# Altium project PieZense_Leader.PrjPcb (part 3 of 3)
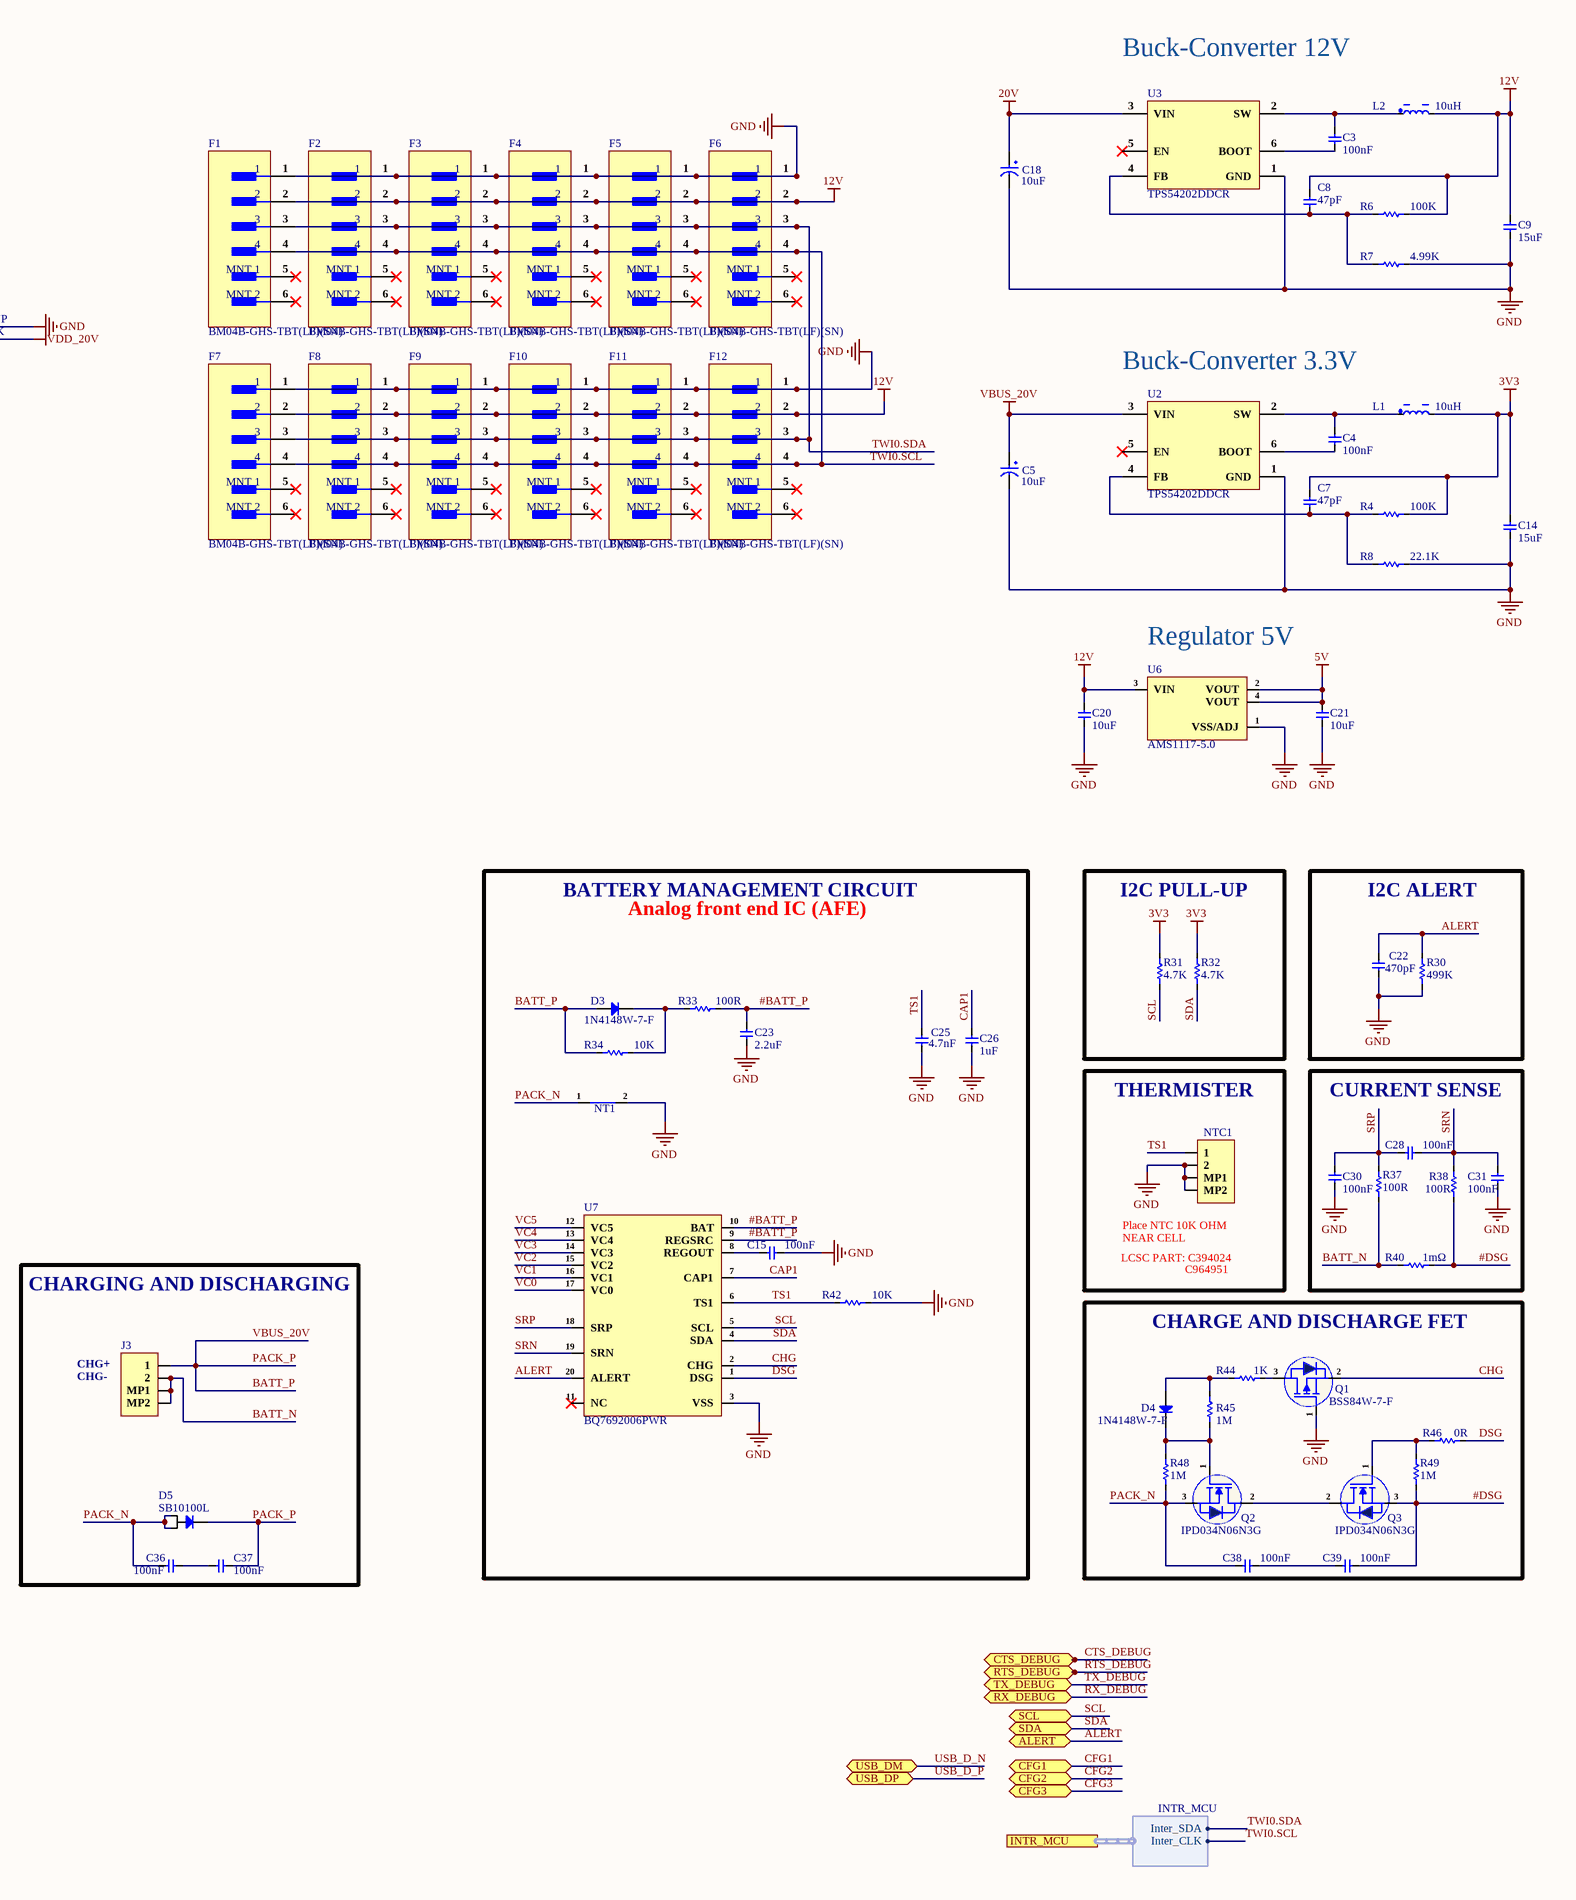
[diagram p4: Piezo_Regulator_Head_Power.SchDoc, right]

## Sheet Piezo_Regulator_Head_Power.SchDoc (continued)

### Library data of the parts (continued)
R44 = RC0805FR-071KL: RES 1K OHM 1% 1/8W 0805; Manufacturer: Yageo; Value: 1kR; Voltage Rating (DC): 150V; Temperature Coefficient: 100ppm/°C; Power Rating: 125mW; Item Type: Resistor; Supplier: Future Electronics; Supplier Part Number: 8126013; Manufacturer Part Number: RC0805FR-071KL; RoHS: Yes; Category: Chip SMD Resistors; Stock: 8305000; Pricing: 5000=0.117, 25000=0.112, 125000=0.107, 500000=0.104, 1250000=0.0981 (USD); Case/Package: 0805; Pins: 2; Case Code (Metric): 2012; Case Code (Imperial): 0805; Min Operating Temperature: -55°C; Max Operating Temperature: 155°C; Tolerance: 1%; Packaging: Tape and Reel; Resistor Type: Thick Film; Package Quantity: 1; Voltage Rating: 150V; Termination: SMD/SMT; Series: RC; Number of Terminations: 2; Max Power Dissipation: 125mW; Features: Moisture Resistant; Resistance Tolerance: 1%; Construction: Rectangular; Voltage Rating (AC): 150V; Length: 0.079inch; Width: 0.049inch; Height: 0.024inch; Depth: 1.25mm; Reach SVHC Compliant: No; Lead Free: 5697LeadFree; RoHS Compliant: Yes; Military Standard: Not; ComponentLink1URL: https://datasheet.ciiva.com/7941/1686128-7941719.pdf?src-supplier=Element14; ComponentLink1Description: https://datasheet.ciiva.com/7941/1686128-7941719.pdf?src-supplier=Element14; ComponentLink2URL: https://datasheet.ciiva.com/46385/444164-46385020.pdf?src-supplier=Element14; ComponentLink2Description: https://datasheet.ciiva.com/46385/444164-46385020.pdf?src-supplier=Element14; ComponentLink3URL: https://datasheet.ciiva.com/2456/pyu-r-int-thick-7-2456976.pdf?src-supplier=Digi-Key; ComponentLink3Description: https://datasheet.ciiva.com/2456/pyu-r-int-thick-7-2456976.pdf?src-supplier=Digi-Key; ComponentLink4URL: https://datasheet.ciiva.com/2456/pyu-r-int-thick-7-2456977.pdf?src-supplier=Digi-Key; ComponentLink4Description: https://datasheet.ciiva.com/2456/pyu-r-int-thick-7-2456977.pdf?src-supplier=Digi-Key; ComponentLink5URL: https://datasheet.ciiva.com/2456/pyu-r-int-thick-7-2456975.pdf?src-supplier=Digi-Key; ComponentLink5Description: https://datasheet.ciiva.com/2456/pyu-r-int-thick-7-2456975.pdf?src-supplier=Digi-Key; ComponentLink6URL: https://datasheet.ciiva.com/16850/rc0805-16850409.pdf?src-supplier=Future+Electronics; ComponentLink6Description: https://datasheet.ciiva.com/16850/rc0805-16850409.pdf?src-supplier=Future+Electronics; LCSC Part Number: C95781
R45 R48 R49 = RC0805FR-071ML: RES 1M OHM 1% 1/8W 0805; Manufacturer: Yageo; Value: 1MR; Power Rating: 125mW; Temperature Coefficient: 250ppm/°C; Voltage Rating: 150V; Item Type: Resistor; Supplier: Future Electronics; Supplier Part Number: 7283393; Manufacturer Part Number: RC0805FR-071ML; RoHS: Yes; Category: Chip SMD Resistors; Stock: 2655000; Pricing: 5000=0.0027, 25000=0.0025, 125000=0.0024, 500000=0.0023, 1250000=0.0021 (USD); Case/Package: Molded; Case Code (Metric): 2012; Case Code (Imperial): 0805; Min Operating Temperature: -55°C; Max Operating Temperature: 155°C; Resistor Type: Thick Film; Tolerance: 1%; Packaging: Tape and Reel; Construction: Rectangular; Resistance Tolerance: 1%; Voltage Rating (AC): 150V; Length: 2mm; Depth: 1.25mm; Lead Free: Lead Free; RoHS Compliant: Yes; Reach SVHC Compliant: Unknown; Military Standard: Not; LCSC Part Number: C107700
R46 = RC0805FR-070RL: RES 0 OHM JUMPER 1/8W 0805; Manufacturer: Yageo; Resistance: 0mR; Tolerance: 1%; Power Rating: 125mW; Item Type: Resistor; Supplier 1: Avnet; Manufacturer Part Number: RC0805FR-070RL; RoHS: Yes; Category: Chip SMD Resistors; Stock 1: 85000; Pricing 1: 5000=0.00281, 10000=0.00277, 20000=0.00269 (USD); Case/Package: 0805; Contact Plating: Tin,Matte; Case Code (Imperial): 0805; Case Code (Metric): 2012; Size Code: 0805; Min Operating Temperature: -55°C; Max Operating Temperature: 155°C; Resistor Type: Thick Film; Packaging: Tape and Reel; Features: Moisture Resistant; Series: RC; Max Power Dissipation: 125mW; Number of Terminations: 2; Construction: Rectangular; Length: 2mm; Depth: 1.25mm; Radiation Hardening: No; Military Standard: Not; Lead Free: Lead Free; RoHS Compliant: Yes; ComponentLink1URL: https://datasheet.ciiva.com/15189/getdatasheetpartid-348154-15189885.pdf?src-supplier=Verical; ComponentLink1Description: https://datasheet.ciiva.com/15189/getdatasheetpartid-348154-15189885.pdf?src-supplier=Verical; ComponentLink2URL: https://datasheet.ciiva.com/17042/rc0805-17042698.pdf?src-supplier=Future+Electronics; ComponentLink2Description: https://datasheet.ciiva.com/17042/rc0805-17042698.pdf?src-supplier=Future+Electronics; Supplier Part Number 1: RC0805FR-070RL; LCSC Part Number: C100045
R54 = CRCW06031K00FKEA: RES SMD 1K OHM 1% 1/10W 0603; Manufacturer: Vishay Dale; Temperature Coefficient: 100ppm/°C; Voltage Rating (DC): 75V; Power Rating: 100mW; Item Type: Resistor; Value: 1kR; Manufacturer Part Number: CRCW06031K00FKEA; RoHS: Yes; Category: Chip SMD Resistors; Case/Package: 0603; Case Code (Imperial): 0603; Case Code (Metric): 1608; Min Operating Temperature: -55°C; Max Operating Temperature: 155°C; Resistor Type: Thick Film; Tolerance: 1%; Packaging: Tape and Reel; Voltage Rating: 75V; Termination: SMD/SMT; Features: Automotive AEC-Q200; Series: CRCW; Max Power Dissipation: 100mW; Number of Terminations: 2; Resistance Tolerance: 1%; Construction: Rectangular; Technology: THICK FILM; Length: 1.55mm; Width: 0.85mm; Height: 0.45mm; Depth: 0.85mm; Reach SVHC Compliant: Unknown; Lead Free: 5697LeadFree; RoHS Compliant: Yes; Military Standard: Not; ComponentLink1URL: https://datasheet.ciiva.com/11808/0900766b80d98afc-11808625.pdf?src-supplier=Rs; ComponentLink1Description: https://datasheet.ciiva.com/11808/0900766b80d98afc-11808625.pdf?src-supplier=Rs; ComponentLink2URL: https://datasheet.ciiva.com/11808/0900766b80d98afc-11808625.pdf?src-supplier=Rs; ComponentLink2Description: https://datasheet.ciiva.com/11808/0900766b80d98afc-11808625.pdf?src-supplier=Rs; ComponentLink3URL: https://datasheet.ciiva.com/46441/1720486-46441623.pdf?src-supplier=Element14; ComponentLink3Description: https://datasheet.ciiva.com/46441/1720486-46441623.pdf?src-supplier=Element14; ComponentLink4URL: https://datasheet.ciiva.com/46441/1720486-46441622.pdf?src-supplier=Element14; ComponentLink4Description: https://datasheet.ciiva.com/46441/1720486-46441622.pdf?src-supplier=Element14; ComponentLink5URL: https://datasheet.ciiva.com/26316/fld-crcw-e3-data-en-26316551.pdf?src-supplier=Distrelec; ComponentLink5Description: https://datasheet.ciiva.com/26316/fld-crcw-e3-data-en-26316551.pdf?src-supplier=Distrelec; ComponentLink6URL: https://datasheet.ciiva.com/2465/dcrcwe3-2465536.pdf?src-supplier=Digi-Key; ComponentLink6Description: https://datasheet.ciiva.com/2465/dcrcwe3-2465536.pdf?src-supplier=Digi-Key; ComponentLink7URL: https://datasheet.ciiva.com/2465/dcrcwe3-2465534.pdf?src-supplier=Digi-Key; ComponentLink7Description: https://datasheet.ciiva.com/2465/dcrcwe3-2465534.pdf?src-supplier=Digi-Key; LCSC Part Number: C844920; ComponentLink8URL: https://datasheet.ciiva.com/16199/dcrcwe3-16199053.pdf?src-supplier=Future+Electronics; ComponentLink8Description: https://datasheet.ciiva.com/16199/dcrcwe3-16199053.pdf?src-supplier=Future+Electronics; ComponentLink9URL: https://datasheet.ciiva.com/46385/1697337-46385497.pdf?src-supplier=Element14; ComponentLink9Description: https://datasheet.ciiva.com/46385/1697337-46385497.pdf?src-supplier=Element14; ComponentLink10URL: https://datasheet.ciiva.com/2465/dcrcwe3-2465535.pdf?src-supplier=Digi-Key; ComponentLink10Description: https://datasheet.ciiva.com/2465/dcrcwe3-2465535.pdf?src-supplier=Digi-Key; ComponentLink11URL: https://datasheet.ciiva.com/8336/dcrcwe3-8336822.pdf?src-supplier=Avnet; ComponentLink11Description: https://datasheet.ciiva.com/8336/dcrcwe3-8336822.pdf?src-supplier=Avnet; ComponentLink12URL: https://datasheet.ciiva.com/3257/dcrcwe3-3257132.pdf?src-supplier=Avnet; ComponentLink12Description: https://datasheet.ciiva.com/3257/dcrcwe3-3257132.pdf?src-supplier=Avnet; Supplier: Mouser; Supplier Part Number: 71-CRCW0603-1.0K-E3; Stock: 1295653; Pricing: 1=0.1, 10=0.017, 50=0.017, 100=0.01, 1000=0.008, 10000=0.004 (USD); Pins: 2; Contact Plating: Tin; Weight: 7.1E-05oz; Package Quantity: 5000; Ratings: AEC-Q200; Radiation Hardening: No; ComponentLink13URL: https://datasheet.ciiva.com/2465/dcrcwe3-2465535.pdf?src-supplier=Digikey; ComponentLink13Description: https://datasheet.ciiva.com/2465/dcrcwe3-2465535.pdf?src-supplier=Digikey; ComponentLink14URL: https://datasheet.ciiva.com/2465/dcrcwe3-2465536.pdf?src-supplier=Digikey; ComponentLink14Description: https://datasheet.ciiva.com/2465/dcrcwe3-2465536.pdf?src-supplier=Digikey; ComponentLink15URL: https://datasheet.ciiva.com/2465/dcrcwe3-2465534.pdf?src-supplier=Digikey; ComponentLink15Description: https://datasheet.ciiva.com/2465/dcrcwe3-2465534.pdf?src-supplier=Digikey
SW1 = 25336NA: SWITCH SLIDE SPDT 4A 125V; Manufacturer: APEM; Item Type: Slide Switches; Actuator Length: 2.3mm; Actuator Material: Glass, Glass fibre, Nylon, Polyamide; Contact Current Rating: 2A; Contact Resistance: 10mΩ; Contact Voltage Rating (AC): 250V; Current Rating: 1A; Dielectric Material: Thermoplastic; Electrical Life: 10kcycles; Insulation Resistance: 1GΩ; Max Voltage Rating (DC): 30V; Mechanical Life: 20kcycles; Number of Positions: 2; Sealable: EPOXY TERMINAL SEALED; Switch Function: On-On; Switch Travel: 4mm; Supplier: Arrow Electronics; Supplier Part Number: 25336NA; Manufacturer Part Number: 25336NA; RoHS: Compliant; Stock: 4; Pricing: 1=2.2457 (USD); Contact Material: Silver; Contact Plating: Silver; Depth: 9.8mm; Height: 8.1mm; Length: 14.1mm; Life (Cycles): 10kcycles; Lifecycle Status: Production; Max Current Rating: 1A; Max Operating Temperature: 85°C; Max Voltage Rating (AC): 250V; Min Operating Temperature: -40°C; Mounting Technology: Through Hole; Orientation: Right Angle; Packaging: Bulk; REACH SVHC: Yes; Terminal Material: Silver; Termination: PC Pin; Throw Configuration: SPDT; Voltage Rating (AC): 125V; Voltage Rating (DC): 30V; Width: 14mm; ComponentLink1URL: https://datasheet.octopart.com:443/25336NA-APEM-datasheet-13521368.pdf?src-supplier=IHS; ComponentLink1Description: https://datasheet.octopart.com:443/25336NA-APEM-datasheet-13521368.pdf?src-supplier=IHS; ComponentLink2URL: https://datasheet.octopart.com:443/25336NA-APEM-datasheet-41567066.pdf?src-supplier=Master+Electronics; ComponentLink2Description: https://datasheet.octopart.com:443/25336NA-APEM-datasheet-41567066.pdf?src-supplier=Master+Electronics; ComponentLink3URL: https://datasheet.octopart.com:443/25336NA-APEM-datasheet-178036094.pdf?src-supplier=TME; ComponentLink3Description: https://datasheet.octopart.com:443/25336NA-APEM-datasheet-178036094.pdf?src-supplier=TME; ComponentLink4URL: https://datasheet.octopart.com:443/25336NA-APEM-datasheet-10337772.pdf?src-supplier=Newark; ComponentLink4Description: https://datasheet.octopart.com:443/25336NA-APEM-datasheet-10337772.pdf?src-supplier=Newark; ComponentLink5URL: https://datasheet.octopart.com:443/25336NA-APEM-datasheet-23707371.pdf?src-supplier=Electro+Sonic; ComponentLink5Description: https://datasheet.octopart.com:443/25336NA-APEM-datasheet-23707371.pdf?src-supplier=Electro+Sonic; ComponentLink6URL: https://datasheet.octopart.com:443/25336NA-APEM-datasheet-165057810.pdf?src-supplier=Burklin+Elektronik; ComponentLink6Description: https://datasheet.octopart.com:443/25336NA-APEM-datasheet-165057810.pdf?src-supplier=Burklin+Elektronik; ComponentLink7URL: https://datasheet.octopart.com:443/25336NA-APEM-datasheet-491718.pdf?src-supplier=Factory+Futures; ComponentLink7Description: https://datasheet.octopart.com:443/25336NA-APEM-datasheet-491718.pdf?src-supplier=Factory+Futures
U2 U3 = TPS54202DDCR: IC REG BUCK ADJ 2A SOT23; Manufacturer: Texas Instruments; Manufacturer Lifecycle Status: ACTIVE; Max Duty Cycle: 100%; Max Supply Voltage: 28V; Max Junction Temperature (Tj): 125°C; Min Input Voltage: 4.5V; Min Output Voltage: 596mV; Nominal Supply Current: 45µA; Number of Channels: 1; Output Configuration: Positive; Output Type: Adjustable; Quiescent Current: 40µA; Switching Frequency: 500kHz; Synchronous Rectifier: Yes; Supplier: DigiKey; Supplier Part Number: 296-TPS54202DDCRCT-ND; Manufacturer Part Number: TPS54202DDCR; RoHS: Compliant; Item Type: IC; Stock: 4194; Pricing: 1=1.17, 10=0.844, 25=0.7636, 100=0.6746, 250=0.63224, 500=0.60672, 1000=0.5857 (USD); Case/Package: SOT-23-6; Height: 1.1mm; Lead Free: Lead Free; Length: 2.9mm; Lifecycle Status: Production; Max Operating Temperature: 125°C; Max Output Voltage: 28V; Min Operating Temperature: -40°C; Min Supply Voltage: 4.5V; Mounting Technology: Surface Mount; Number of Outputs: 1; Pins: 6; Output Current: 2A; Schedule B: 8542390000, 8542390000|8542390000|8542390000|8542390000|8542390000; Thickness: 870µm; Topology: Buck; Width: 1.6mm; ComponentLink1URL: https://sigma.octopart.com:443/180581133/technical_drawing/Texas-Instruments-TPS54202DDCR.pdf?src-supplier=Texas+Instruments; ComponentLink1Description: https://sigma.octopart.com:443/180581133/technical_drawing/Texas-Instruments-TPS54202DDCR.pdf?src-supplier=Texas+Instruments; ComponentLink2URL: https://octopart.com:443/opatz8j6/c1?t=FAFTCw9MUHEpg05pud1ULAyccV128Rvs4kpgtbIHJK4QnZYUn5DIlTqILZCRn3OGKuIK2OAwsfJUaHqp_uWt2XWRUIWZjvnlSsBH8aSBLHpCm5pUgjYkmYK7aQZ1tKHDT4GDuf94S2TW-N1iaYVMc29JfnO6Y5xBGsqSuWmXlwMR5Pf7MLFg3XCbpaNjJfeHg6VBfvWZIp62-z7iIfeN-xLXbqauIUvBeZHqQTWCwBkKVxqgCgQQwDnJZoJ9yjTomjI04wnmJO18egisqEyqoosAlQPDDAhdHAxkSRGJnBHeBom8jBmTnp4C8Wpyey22POweYbBp_aNhdPUtTJQM6gKaI5oNKWbufVAnfV7bde1UKHIaUN1cgnNmWHvEiIDYXKFykrh0&src-supplier=Texas+Instruments; ComponentLink2Description: https://octopart.com:443/opatz8j6/c1?t=FAFTCw9MUHEpg05pud1ULAyccV128Rvs4kpgtbIHJK4QnZYUn5DIlTqILZCRn3OGKuIK2OAwsfJUaHqp_uWt2XWRUIWZjvnlSsBH8aSBLHpCm5pUgjYkmYK7aQZ1tKHDT4GDuf94S2TW-N1iaYVMc29JfnO6Y5xBGsqSuWmXlwMR5Pf7MLFg3XCbpaNjJfeHg6VBfvWZIp62-z7iIfeN-xLXbqauIUvBeZHqQTWCwBkKVxqgCgQQwDnJZoJ9yjTomjI04wnmJO18egisqEyqoosAlQPDDAhdHAxkSRGJnBHeBom8jBmTnp4C8Wpyey22POweYbBp_aNhdPUtTJQM6gKaI5oNKWbufVAnfV7bde1UKHIaUN1cgnNmWHvEiIDYXKFykrh0&src-supplier=Texas+Instruments; ComponentLink3URL: https://sigma.octopart.com:443/179311906/technical_drawing/Texas-Instruments-TPS54202DDCR.pdf?src-supplier=Texas+Instruments; ComponentLink3Description: https://sigma.octopart.com:443/179311906/technical_drawing/Texas-Instruments-TPS54202DDCR.pdf?src-supplier=Texas+Instruments; ComponentLink4URL: https://sigma.octopart.com:443/159779760/technical_drawing/Texas-Instruments-TPS54202DDCR.pdf?src-supplier=Texas+Instruments; ComponentLink4Description: https://sigma.octopart.com:443/159779760/technical_drawing/Texas-Instruments-TPS54202DDCR.pdf?src-supplier=Texas+Instruments; ComponentLink5URL: https://sigma.octopart.com:443/149167535/technical_drawing/Texas-Instruments-TPS54202DDCR.pdf?src-supplier=Texas+Instruments; ComponentLink5Description: https://sigma.octopart.com:443/149167535/technical_drawing/Texas-Instruments-TPS54202DDCR.pdf?src-supplier=Texas+Instruments; ComponentLink6URL: https://sigma.octopart.com:443/49250152/technical_drawing/Texas-Instruments-TPS54202DDCR.pdf?src-supplier=Texas+Instruments; ComponentLink6Description: https://sigma.octopart.com:443/49250152/technical_drawing/Texas-Instruments-TPS54202DDCR.pdf?src-supplier=Texas+Instruments; ComponentLink7URL: https://datasheet.octopart.com:443/TPS54202DDCR-Texas-Instruments-datasheet-100480396.pdf?src-supplier=Upverter; ComponentLink7Description: https://datasheet.octopart.com:443/TPS54202DDCR-Texas-Instruments-datasheet-100480396.pdf?src-supplier=Upverter; ComponentLink8URL: https://datasheet.octopart.com:443/TPS54202DDCR-Texas-Instruments-datasheet-165804749.pdf?src-supplier=LCSC; ComponentLink8Description: https://datasheet.octopart.com:443/TPS54202DDCR-Texas-Instruments-datasheet-165804749.pdf?src-supplier=LCSC; ComponentLink9URL: https://datasheet.octopart.com:443/TPS54202DDCR-Texas-Instruments-datasheet-159118069.pdf?src-supplier=LCSC; ComponentLink9Description: https://datasheet.octopart.com:443/TPS54202DDCR-Texas-Instruments-datasheet-159118069.pdf?src-supplier=LCSC; ComponentLink10URL: https://datasheet.octopart.com:443/TPS54202DDCR-Texas-Instruments-datasheet-142296497.pdf?src-supplier=Arrow.cn; ComponentLink10Description: https://datasheet.octopart.com:443/TPS54202DDCR-Texas-Instruments-datasheet-142296497.pdf?src-supplier=Arrow.cn; ComponentLink11URL: http://sigma.octopart.com:80/conflict_mineral_statement/Texas-Instruments-company-63.pdf?src-supplier=Compliance+Statements; ComponentLink11Description: http://sigma.octopart.com:80/conflict_mineral_statement/Texas-Instruments-company-63.pdf?src-supplier=Compliance+Statements; ComponentLink12URL: http://sigma.octopart.com:80/reach_statement/Texas-Instruments-company-64.pdf?src-supplier=Compliance+Statements; ComponentLink12Description: http://sigma.octopart.com:80/reach_statement/Texas-Instruments-company-64.pdf?src-supplier=Compliance+Statements
U5 = CH224K: ESSOP-10-150mil-1mm USB PD ROHS; Manufacturer: WCH; Item Type: IC; Manufacturer Part Number: CH224K; Package: ESSOP-10-150mil-1mm; LCSC Part Number: C970725; ComponentLink1Description: LCSC; ComponentLink1URL: https://www.lcsc.com/product-detail/USB-PD_WCH-Jiangsu-Qin-Heng-CH224K_C970725.html
U6 = AMS1117-5.0: SOT-223 Linear Voltage Regulators (LDO) ROHS; Manufacturer: HX(hengjiaxing); Item Type: IC; Manufacturer Part Number: AMS1117-5.0; Package: SOT-223; LCSC Part Number: C5181462; ComponentLink1Description: LCSC; ComponentLink1URL: https://www.lcsc.com/product-detail/Linear-Voltage-Regulators-LDO_HX-hengjiaxing-AMS1117-5-0_C5181462.html
U7 = BQ7692006PWR: IC BATT MON MULTI 3-5C 20TSSOP; Manufacturer: Texas Instruments; Supplier: Mouser; Supplier Part Number: 595-BQ7692006PWR; Manufacturer Part Number: BQ7692006PWR; RoHS: Yes; Category: Battery Management; Stock: 12739; Pricing: 1=3.26, 10=2.77, 50=2.77, 100=2.41, 1000=1.73, 10000=1.53 (USD); ComponentLink1URL: https://datasheet.ciiva.com/48478/bq76920-48478374.pdf?src-supplier=Avnet; ComponentLink1Description: https://datasheet.ciiva.com/48478/bq76920-48478374.pdf?src-supplier=Avnet
U8 = CP2102N-A02-GQFN24R: IC USB TO UART BRIDGE QFN24; Manufacturer: Silicon Labs; Supplier 1: Digi-Key; Manufacturer Part Number: CP2102N-A02-GQFN24R; RoHS: Yes; Item Type: IC; Pricing 1: 1=1.56000 (USD); Supplier Part Number 1: 336-5888-1-ND; LCSC Part Number: C969151

## Nets that join several sheets
3V3: Piezo_Regulator_Head_MCU (13 pins), Piezo_Regulator_Head_Power (10 pins)
5V: Piezo_Regulator_Head_MCU (C6.2 C17.2 LED1.1 U4.5), Piezo_Regulator_Head_Power (C21.2 U6.2 U6.4)
12V: Piezo_Regulator_Head_MCU (P1.10), Piezo_Regulator_Head_Power (18 pins)
20V: Piezo_Regulator_Head_MCU (P1.1 R13.2), Piezo_Regulator_Head_Power (C18.1 SW1.3 U3.3)
GND: Piezo_Regulator_Head_MCU (36 pins), Piezo_Regulator_Head_Power (54 pins)
ALERT: Piezo_Regulator_Head_MCU (U1.J9), Piezo_Regulator_Head_Power (C22.2 R30.2 U7.20)
CFG1: Piezo_Regulator_Head_MCU (R5.1), Piezo_Regulator_Head_Power (R24.1 U5.9)
CFG2: Piezo_Regulator_Head_MCU (R16.1), Piezo_Regulator_Head_Power (U5.2)
CFG3: Piezo_Regulator_Head_MCU (R17.1), Piezo_Regulator_Head_Power (U5.3)
CTS_DEBUG: Piezo_Regulator_Head_MCU (U1.J7), Piezo_Regulator_Head_Power (U8.18)
RTS_DEBUG: Piezo_Regulator_Head_MCU (U1.H9), Piezo_Regulator_Head_Power (U8.19)
RX_DEBUG: Piezo_Regulator_Head_MCU (U1.F7), Piezo_Regulator_Head_Power (U8.21)
SCL: Piezo_Regulator_Head_MCU (U1.D7), Piezo_Regulator_Head_Power (R31.1 U7.5)
SDA: Piezo_Regulator_Head_MCU (U1.H7), Piezo_Regulator_Head_Power (R32.1 U7.4)
TWI0.SCL: Piezo_Regulator_Head_MCU (R1.1 R12.2 TVS1.1), Piezo_Regulator_Head_Power (12 pins)
TWI0.SDA: Piezo_Regulator_Head_MCU (R2.1 R11.2 TVS1.2), Piezo_Regulator_Head_Power (12 pins)
TX_DEBUG: Piezo_Regulator_Head_MCU (U1.G1), Piezo_Regulator_Head_Power (U8.20)
USB_D_N: Piezo_Regulator_Head_MCU (R57.2), Piezo_Regulator_Head_Power (R26.2 U8.4)
USB_D_P: Piezo_Regulator_Head_MCU (R58.2), Piezo_Regulator_Head_Power (R28.2 U8.3)